# EAGLE design PCB_Robotique_EAGLE_Robotique_TEST (EAGLE 9.3.0)
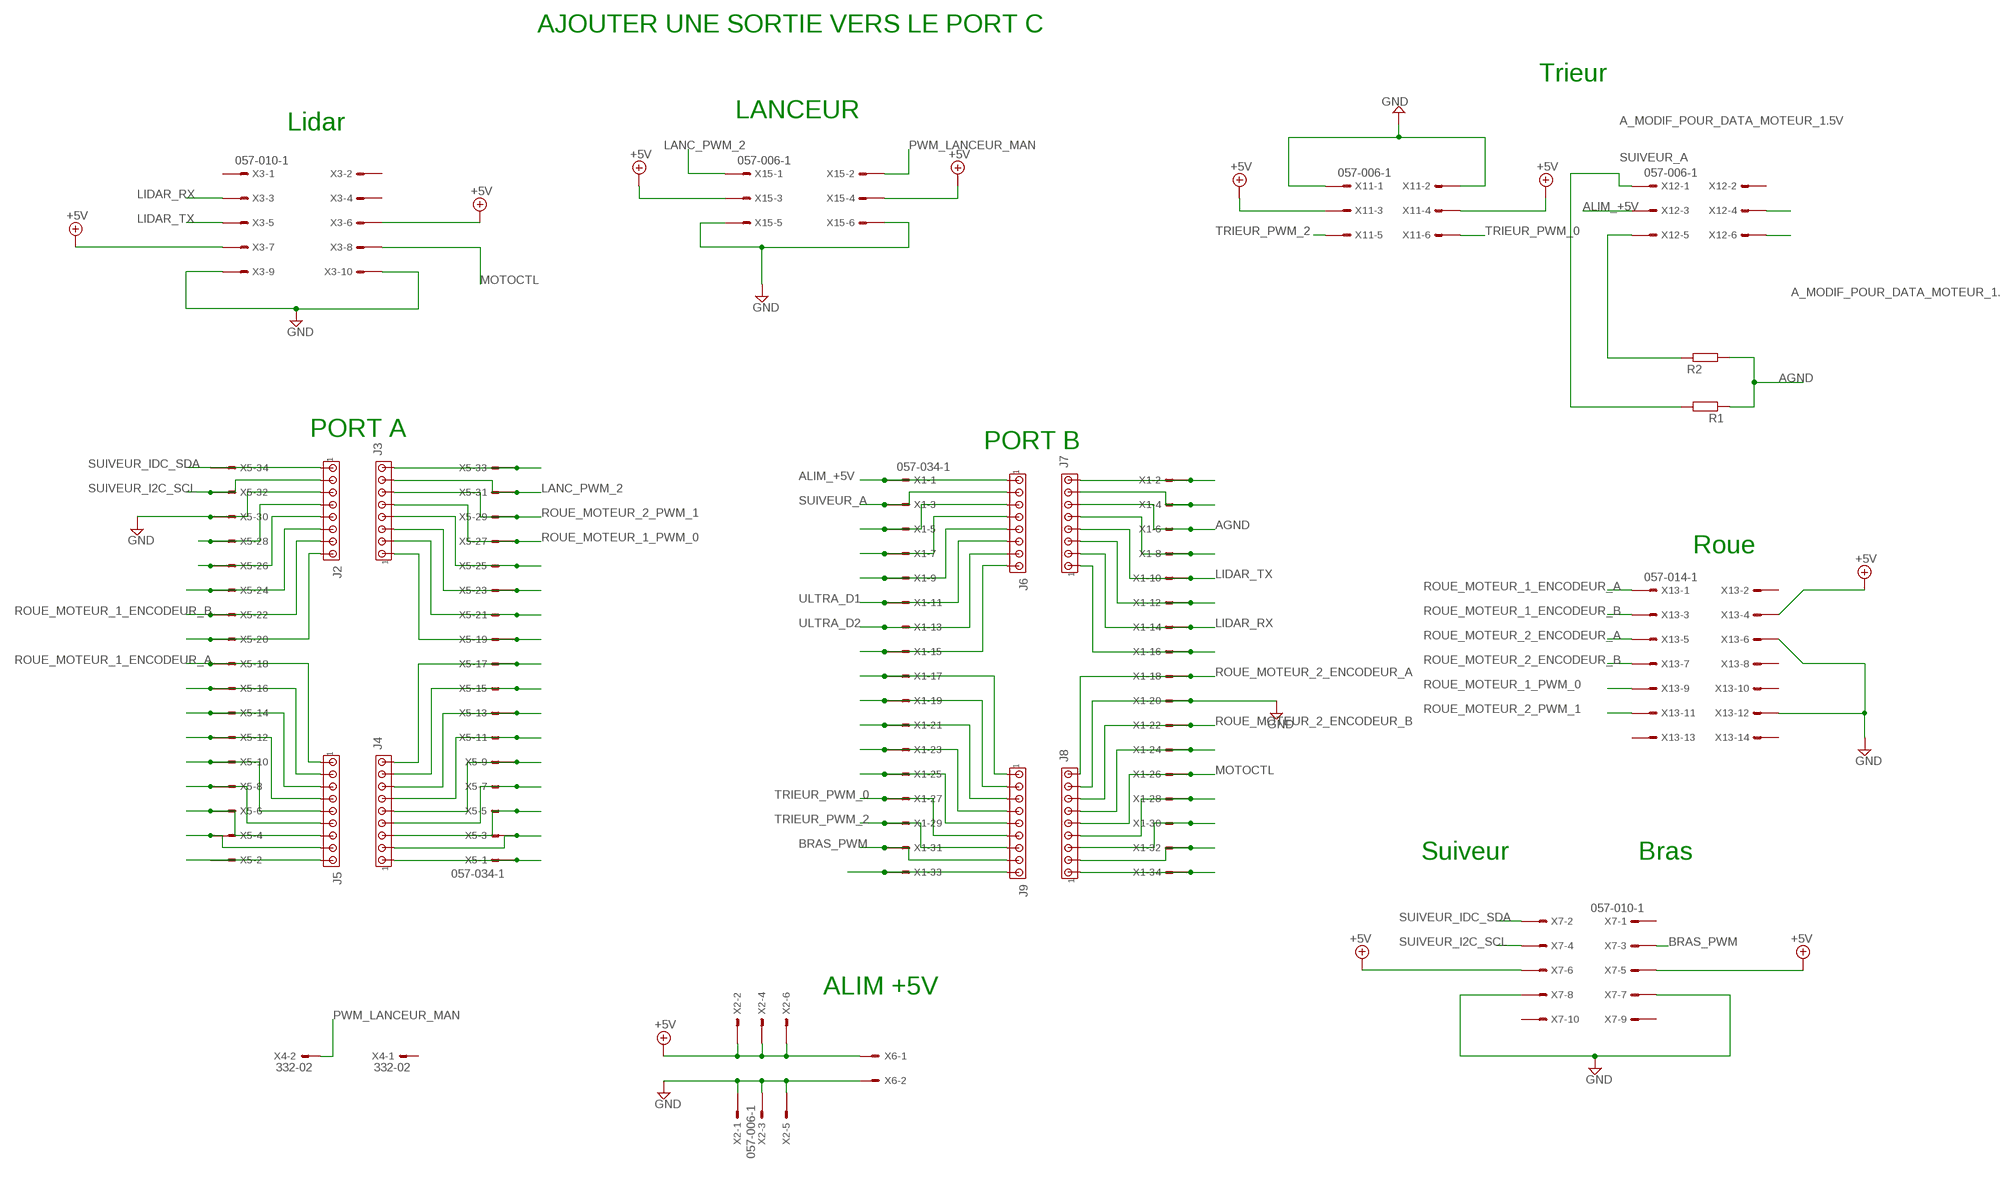
[diagram p0: schematic, sheet 1]

## Parts
J2  MTA08-100  [10X08MTA]
J3  MTA08-100  [10X08MTA]
J4  MTA09-100  [10X09MTA]
J5  MTA09-100  [10X09MTA]
J6  MTA08-100  [10X08MTA]
J7  MTA08-100  [10X08MTA]
J8  MTA09-100  [10X09MTA]
J9  MTA09-100  [10X09MTA]
R1  R1/4W  [R]
R2  R1/4W  [R]
X1  057-034-1  [057-034-1]
X2  057-006-1  [057-006-1]
X3  057-010-1  [057-010-1]
X4  332-02  [332-02]
X5  057-034-1  [057-034-1]
X6  KK-156-2  [KK-156-2]
X7  057-010-1  [057-010-1]
X11  057-006-1  [057-006-1]
X12  057-006-1  [057-006-1]
X13  057-014-1  [057-014-1]
X15  057-006-1  [057-006-1]

## Nets
4B: J7.7 X1.4
+5V: X2.2 X2.4 X2.6 X3.6 X3.7 X6.1 X7.5 X7.6 X11.3 X11.4 X13.4 X15.3 X15.4
A_MODIF_POUR_DATA_MOTEUR_1.5V: R2.1 X12.5
AGND: J7.6 R1.1 R2.2 X1.6
ALIM_+5V: J6.1 X1.1 X12.3
BRAS_PWM: J9.8 X1.31 X7.3
GND: J2.3 J8.8 X1.20 X2.1 X2.3 X2.5 X3.9 X3.10 X5.30 X6.2 X7.7 X7.8 X11.1 X11.2 X13.6 X13.12 X15.5 X15.6
LANC_PWM_2: J3.7 X5.31 X15.1
LIDAR_RX: J7.2 X1.14 X3.3
LIDAR_TX: J7.4 X1.10 X3.5
MOTOCTL: J8.5 X1.26 X3.8
N$1: J2.4 X5.28
N$3: J2.5 X5.26
N$4: J2.6 X5.24
N$6: J5.2 X5.16
N$7: J7.8 X1.2
N$9: J5.4 X5.12
N$10: J2.8 X5.20
N$11: J5.6 X5.8
N$13: J5.8 X5.4
N$14: J5.9 X5.2
N$15: J3.8 X5.33
N$16: J3.4 X5.25
N$17: J3.3 X5.23
N$18: J3.2 X5.21
N$19: J3.1 X5.19
N$20: J4.9 X5.17
N$21: J7.5 X1.8
N$23: J7.3 X1.12
N$24: J4.8 X5.15
N$25: J4.7 X5.13
N$26: J4.6 X5.11
N$27: J4.5 X5.9
N$28: J4.4 X5.7
N$29: J4.3 X5.5
N$30: J4.2 X5.3
N$31: J4.1 X5.1
N$33: J7.1 X1.16
N$34: J8.6 X1.24
N$36: J8.4 X1.28
N$37: J8.3 X1.30
N$38: J8.2 X1.32
N$39: J8.1 X1.34
N$40: J9.9 X1.33
N$41: J9.5 X1.25
N$42: J9.4 X1.23
N$43: J9.3 X1.21
N$44: J9.2 X1.19
N$45: J9.1 X1.17
N$46: J6.8 X1.15
N$47: J6.5 X1.9
N$48: J6.4 X1.7
N$49: J6.3 X1.5
N$51: X12.4
N$52: X12.6
N$59: J5.7 X5.6
PWM_LANCEUR_MAN: X4.2 X15.2
ROUE_MOTEUR_1_ENCODEUR_A: J5.1 X5.18 X13.1
ROUE_MOTEUR_1_ENCODEUR_B: J2.7 X5.22 X13.3
ROUE_MOTEUR_1_PWM_0: J3.5 X5.27 X13.9
ROUE_MOTEUR_2_ENCODEUR_A: J8.9 X1.18 X13.5
ROUE_MOTEUR_2_ENCODEUR_B: J8.7 X1.22 X13.7
ROUE_MOTEUR_2_PWM_1: J3.6 X5.29 X13.11
SDFSDFSGD: J5.5 X5.10
SDSSDFD: J5.3 X5.14
SUIVEUR_A: J6.2 R1.2 X1.3 X12.1
SUIVEUR_I2C_SCL: J2.2 X5.32 X7.4
SUIVEUR_IDC_SDA: J2.1 X5.34 X7.2
TRIEUR_PWM_0: J9.6 X1.27 X11.6
TRIEUR_PWM_2: J9.7 X1.29 X11.5
ULTRA_D1: J6.6 X1.11
ULTRA_D2: J6.7 X1.13
Unconnected: X3.1 X3.2 X3.4 X4.1 X7.1 X7.9 X7.10 X12.2 X13.2 X13.8 X13.10 X13.13 X13.14

## Notes on the sheet
- AJOUTER UNE SORTIE VERS LE PORT C
- Trieur
- LANCEUR
- Lidar
- PORT A
- PORT B
- Roue
- Suiveur | Bras
- ALIM +5V

## Library data of the parts
J2 J3 J6 J7 = con-amp:MTA08-100: AMP connector
J4 J5 J8 J9 = con-amp:MTA09-100: AMP connector
R1 R2 = isenproject:R: RESISTOR, European symbol
X1 X5 = con-panduit:057-034-: CONNECTOR 34-pin series 057 contact pc board low profile headers; OC_FARNELL: unknown; OC_NEWARK: unknown
X2 X11 X12 X15 = con-panduit:057-006-: CONNECTOR 6-pin series 057 contact pc board low profile headers; OC_FARNELL: unknown; OC_NEWARK: unknown
X3 X7 = con-panduit:057-010-: CONNECTOR 10-pin series 057 contact pc board low profile headers; OC_FARNELL: unknown; OC_NEWARK: unknown
X4 = con-garry:332-02: 2 Pin - 2mm Dual Row Source: www.mpe-connector.de / garry_shortform_2012.pdf
X6 = isenproject:KK-156-2: KK 156 HEADER Source: http://www.molex.com/pdm_docs/sd/026604100_sd.pdf; OC_FARNELL: unknown; OC_NEWARK: unknown
X13 = con-panduit:057-014-: CONNECTOR 10-pin series 057 contact pc board low profile headers; OC_FARNELL: unknown; OC_NEWARK: unknown

## Board
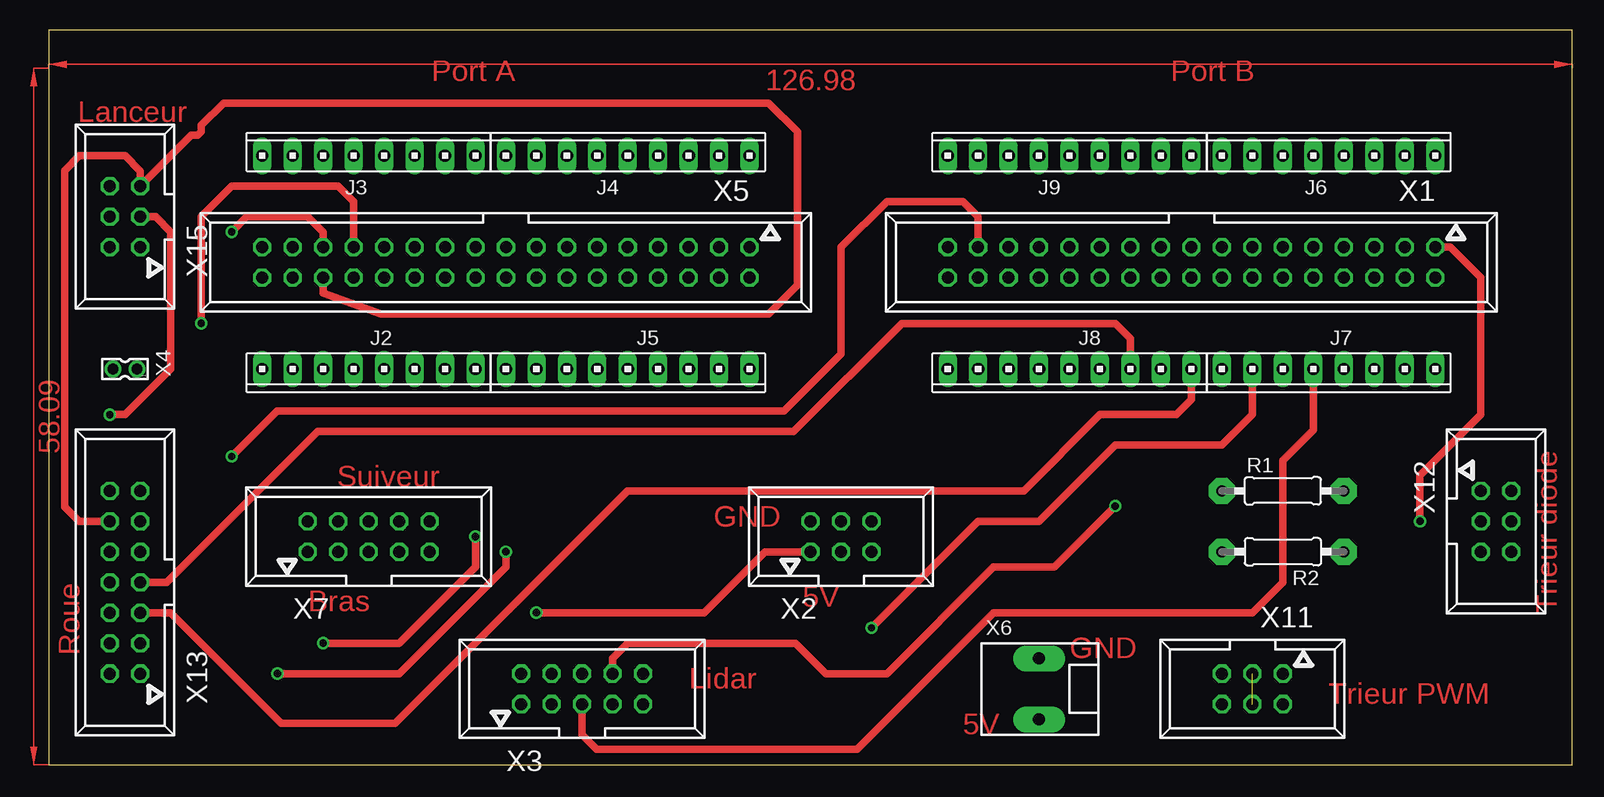
[diagram p1: board, top side]
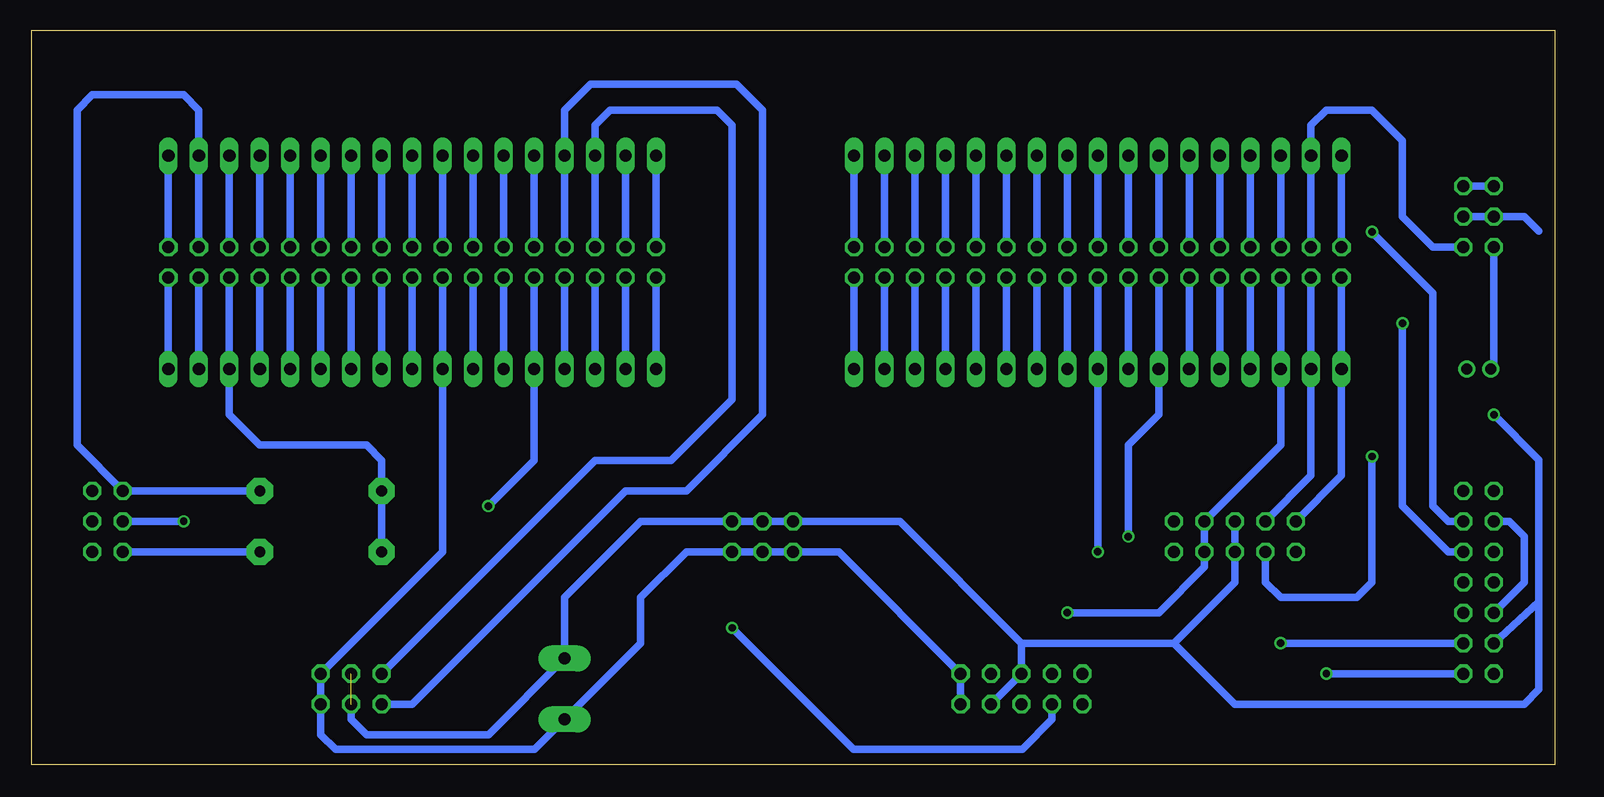
[diagram p2: board, bottom side, seen from below]

Size 126.98 x 61.29 mm. Coordinates in mm from the lower left corner, seen from the top.
Outline: 0,0 126.98,0 126.98,61.29 0,61.29 0,0
Copper layers (1*16): Top 0.035mm / dielectric 1.5mm / Bottom 0.035mm
Design rules "default": minimum track width 10mil, minimum drill 24mil, track to track 8mil, track to pad 8mil, pad to pad 8mil, via to via 8mil, smd to smd 8mil, copper to edge 40mil, drill to drill 8mil, minimum pad ring 10mil, minimum via ring 8mil, stop-mask expansion 4mil, vias tented up to drill 0mil, thermal gap 10mil

### Footprints (pad centres in the part's own frame; a part is rotated, then mirrored left to right if it is on the bottom)
10X08MTA = drill 1.016 long: 1 8.89,0; 2 6.35,0; 3 3.81,0; 4 1.27,0; 5 -1.27,0; 6 -3.81,0; 7 -6.35,0; 8 -8.89,0
10X09MTA = drill 1.016 long: 1 10.16,0; 2 7.62,0; 3 5.08,0; 4 2.54,0; 5 0,0; 6 -2.54,0; 7 -5.08,0; 8 -7.62,0; 9 -10.16,0
R = drill 0.9 pad 2.184 octagon: 1 -5.08,0; 2 5.08,0
057-034-1 = drill 1 octagon: 1 -20.32,-1.27; 2 -20.32,1.27; 3 -17.78,-1.27; 4 -17.78,1.27; 5 -15.24,-1.27; 6 -15.24,1.27; 7 -12.7,-1.27; 8 -12.7,1.27; 9 -10.16,-1.27; 10 -10.16,1.27; 11 -7.62,-1.27; 12 -7.62,1.27; 13 -5.08,-1.27; 14 -5.08,1.27; 15 -2.54,-1.27; 16 -2.54,1.27; 17 0,-1.27; 18 0,1.27; 19 2.54,-1.27; 20 2.54,1.27; 21 5.08,-1.27; 22 5.08,1.27; 23 7.62,-1.27; 24 7.62,1.27; 25 10.16,-1.27; 26 10.16,1.27; 27 12.7,-1.27; 28 12.7,1.27; 29 15.24,-1.27; 30 15.24,1.27; 31 17.78,-1.27; 32 17.78,1.27; 33 20.32,-1.27; 34 20.32,1.27
057-006-1 = drill 1 octagon: 1 -2.54,-1.27; 2 -2.54,1.27; 3 0,-1.27; 4 0,1.27; 5 2.54,-1.27; 6 2.54,1.27
057-010-1 = drill 1 octagon: 1 -5.08,-1.27; 2 -5.08,1.27; 3 -2.54,-1.27; 4 -2.54,1.27; 5 0,-1.27; 6 0,1.27; 7 2.54,-1.27; 8 2.54,1.27; 9 5.08,-1.27; 10 5.08,1.27
332-02 = drill 0.9 pad 1.27: 1 0,-1; 2 0,1
KK-156-2 = drill 1 pad 2.184 long: 1 -2.54,0; 2 2.54,0
057-014-1 = drill 1 octagon: 1 -7.62,-1.27; 2 -7.62,1.27; 3 -5.08,-1.27; 4 -5.08,1.27; 5 -2.54,-1.27; 6 -2.54,1.27; 7 0,-1.27; 8 0,1.27; 9 2.54,-1.27; 10 2.54,1.27; 11 5.08,-1.27; 12 5.08,1.27; 13 7.62,-1.27; 14 7.62,1.27

### Placement (x,y rotation side)
J2  26.67,33.02 180 top
J3  26.67,50.8 0 top
J4  48.26,50.8 0 top
J5  48.26,33.02 180 top
J6  106.68,50.8 0 top
J7  106.68,33.02 180 top
J8  85.09,33.02 180 top
J9  85.09,50.8 0 top
R1  102.87,22.86 0 top
R2  102.87,17.78 180 top
X1  95.25,41.91 180 top
X2  66.04,19.05 0 top
X3  44.45,6.35 0 top
X4  6.35,33.02 90 top
X5  38.1,41.91 180 top
X6  82.55,6.35 270 top
X7  26.67,19.05 0 top
X11  100.33,6.35 180 top
X12  120.65,20.32 270 top
X13  6.35,15.24 90 top
X15  6.35,45.72 90 top

### Tracks (layer width: path | path; a pad name or v marks a point on that pad's centre or on a via)
4B
  Bottom 0.61: J7.7 X1.4
+5V  (via drill 0.61)  (1 unrouted)
  Top 0.61: X15.3 8.89,45.72 10.16,44.45 10.16,33.02 6.35,29.21 v5.08,29.21
  Bottom 0.61: X7.6 X7.5 26.67,15.24 31.75,10.16 | X3.7 X3.6 44.45,10.16 | X11.4 100.33,3.81 99.06,2.54 88.9,2.54 X6.1 82.55,13.97 76.2,20.32 X2.6 X2.4 X2.2 54.61,20.32 44.45,10.16 | 44.45,10.16 31.75,10.16 | X15.3 X15.4 2.54,45.72 1.32,44.5 | 31.75,10.16 26.67,5.08 2.54,5.08 1.32,6.3 1.32,10.3 1.32,13.6 | v5.08,29.21 1.32,25.45 1.32,13.6 | 4.94,10.3 X13.4 1.32,13.6
A_MODIF_POUR_DATA_MOTEUR_1.5V
  Bottom 0.61: X12.5 R2.1
AGND
  Bottom 0.61: X1.6 J7.6 110.49,29.21 107.95,26.67 99.06,26.67 97.79,25.4 R1.1 R2.2
ALIM_+5V  (via drill 0.61)
  Top 0.61: v114.3,20.32 114.3,24.13 119.38,29.21 119.38,40.64 116.84,43.18 X1.1
  Bottom 0.61: J6.1 X1.1 | X12.3 v114.3,20.32
BRAS_PWM  (via drill 0.61)
  Top 0.61: X1.31 77.47,45.72 76.2,46.99 69.85,46.99 66.04,43.18 66.04,34.29 61.29,29.54 19.05,29.54 v15.24,25.73
  Bottom 0.61: J9.8 X1.31 | X7.3 24.13,15.24 22.86,13.97 16.51,13.97 15.24,15.24 v15.24,25.73
GND  (via drill 0.61)
  Top 0.61: X2.1 59.69,17.78 54.61,12.7 v40.64,12.7 | X13.12 2.54,20.32 1.32,21.54 1.32,49.58 2.54,50.8 6.35,50.8 7.62,49.53 X15.5 11.86,52.5 12.4,52.5 12.69,52.8 12.69,53.33 14.56,55.2 60,55.2 62.4,52.8 62.4,40 60,37.6 27.7,37.6 22.86,39.37 X5.30
  Bottom 0.61: X5.30 J2.3 22.86,26.67 X7.8 X7.7 29.21,16.51 33.02,12.7 v40.64,12.7 | X1.20 J8.8 92.71,17.78 X11.1 X11.2 102.87,2.54 101.65,1.32 85.04,1.32 X6.2 76.2,10.16 76.2,13.97 72.39,17.78 X2.5 X2.3 X2.1 59.69,17.78 X3.10 X3.9 | X15.6 X15.5 | X13.12 3.81,20.32 2.54,19.05 2.54,16.51 2.54,15.24 X13.6
LANC_PWM_2
  Bottom 0.61: X5.31 J3.7 20.32,53.34 19.05,54.61 15.24,54.61 12.7,52.07 12.7,45.72 11.43,44.45 10.16,43.18 X15.1
LIDAR_RX  (via drill 0.61)
  Top 0.61: 100.33,31.75 J7.2 100.33,29.21 97.79,26.67 88.9,26.67 82.55,20.32 77.47,20.32 v68.58,11.43
  Bottom 0.61: J7.2 X1.14 | X3.3 41.91,3.81 44.4,1.32 58.47,1.32 v68.58,11.43
LIDAR_TX
  Top 0.61: X3.5 44.45,2.54 45.67,1.32 67.36,1.32 | J7.4 105.41,27.94 102.87,25.4 102.87,15.24 100.33,12.7 78.74,12.7 67.36,1.32 | 67.36,1.32
  Bottom 0.61: X1.10 J7.4
MOTOCTL  (via drill 0.61)
  Top 0.61: X3.8 46.99,8.89 48.26,10.16 62.23,10.16 64.77,7.62 69.85,7.62 78.74,16.51 83.82,16.51 v88.9,21.59
  Bottom 0.61: X1.26 J8.5 85.09,25.4 v88.9,21.59
N$1
  Bottom 0.61: X5.28 J2.4
N$3
  Bottom 0.61: J2.5 X5.26
N$4
  Bottom 0.61: X5.24 J2.6
N$6
  Bottom 0.61: X5.16 J5.2
N$7
  Bottom 0.61: X1.2 J7.8
N$9
  Bottom 0.61: J5.4 X5.12
N$10
  Bottom 0.61: X5.20 J2.8
N$11
  Bottom 0.61: J5.6 X5.8
N$13
  Bottom 0.61: J5.8 X5.4
N$14
  Bottom 0.61: J5.9 X5.2
N$15
  Bottom 0.61: J3.8 X5.33
N$16
  Bottom 0.61: X5.25 J3.4
N$17
  Bottom 0.61: X5.23 J3.3
N$18
  Bottom 0.61: X5.21 J3.2
N$19
  Bottom 0.61: X5.19 J3.1
N$20
  Bottom 0.61: X5.17 J4.9
N$21
  Bottom 0.61: J7.5 X1.8
N$23
  Bottom 0.61: J7.3 X1.12
N$24
  Bottom 0.61: X5.15 J4.8
N$25
  Bottom 0.61: X5.13 J4.7
N$26
  Bottom 0.61: J4.6 X5.11
N$27
  Bottom 0.61: X5.9 J4.5
N$28
  Bottom 0.61: J4.4 X5.7
N$29
  Bottom 0.61: X5.5 J4.3
N$30
  Bottom 0.61: J4.2 X5.3
N$31
  Bottom 0.61: X5.1 J4.1
N$33
  Bottom 0.61: X1.16 J7.1
N$34
  Bottom 0.61: X1.24 J8.6
N$36
  Bottom 0.61: X1.28 J8.4
N$37
  Bottom 0.61: J8.3 X1.30
N$38
  Bottom 0.61: X1.32 J8.2
N$39
  Bottom 0.61: J8.1 X1.34
N$40
  Bottom 0.61: X1.33 J9.9
N$41
  Bottom 0.61: X1.25 J9.5
N$42
  Bottom 0.61: X1.23 J9.4
N$43
  Bottom 0.61: X1.21 J9.3
N$44
  Bottom 0.61: J9.2 X1.19
N$45
  Bottom 0.61: X1.17 J9.1
N$46
  Bottom 0.61: J6.8 X1.15
N$47
  Bottom 0.61: X1.9 J6.5
N$48
  Bottom 0.61: J6.4 X1.7
N$49
  Bottom 0.61: X1.5 J6.3
N$59
  Bottom 0.61: J5.7 X5.6
PWM_LANCEUR_MAN
  Bottom 0.61: X15.2 5.08,33.29 X4.2
ROUE_MOTEUR_1_ENCODEUR_A  (via drill 0.61)
  Top 0.61: v19.05,7.62 29.21,7.62 38.1,16.51 v38.1,17.78
  Bottom 0.61: 38.1,34.29 J5.1 | J5.1 X5.18 | v19.05,7.62 X13.1 | v38.1,17.78 J5.1
ROUE_MOTEUR_1_ENCODEUR_B  (via drill 0.61)
  Top 0.61: v22.86,10.16 29.21,10.16 35.56,16.51 v35.56,19.05
  Bottom 0.61: X5.22 J2.7 33.02,29.21 35.56,26.67 v35.56,19.05 | X13.3 v22.86,10.16
ROUE_MOTEUR_1_PWM_0  (via drill 0.61)
  Top 0.61: X5.27 25.4,46.99 24.13,48.26 15.24,48.26 12.7,45.72 v12.7,36.83
  Bottom 0.61: X5.27 J3.5 | v12.7,36.83 12.7,21.59 8.89,17.78 X13.9
ROUE_MOTEUR_2_ENCODEUR_A
  Top 0.61: J8.9 95.25,30.48 93.98,29.21 87.63,29.21 81.28,22.86 48.26,22.86 28.88,3.48 19.38,3.48 10.16,12.7 X13.5
  Bottom 0.61: 95.25,34.29 J8.9 X1.18
ROUE_MOTEUR_2_ENCODEUR_B
  Top 0.61: J8.7 90.17,35.56 88.9,36.83 71.12,36.83 62.09,27.8 22.39,27.8 9.83,15.24 X13.7
  Bottom 0.61: J8.7 X1.22
ROUE_MOTEUR_2_PWM_1  (via drill 0.61)
  Top 0.61: v15.24,44.45 16.51,45.72 21.59,45.72 22.86,44.45 X5.29
  Bottom 0.61: X5.29 J3.6 | v15.24,44.45 10.16,39.37 10.16,35.56 10.16,21.59 8.89,20.32 X13.11
SDFSDFSGD
  Bottom 0.61: J5.5 X5.10
SDSSDFD
  Bottom 0.61: J5.3 X5.14
SUIVEUR_A
  Bottom 0.61: R1.2 X12.1 123.19,26.67 123.19,54.61 121.92,55.88 114.3,55.88 113.03,54.61 J6.2 X1.3
SUIVEUR_I2C_SCL
  Bottom 0.61: X5.32 J2.2 20.32,24.13 X7.4
SUIVEUR_IDC_SDA
  Bottom 0.61: X5.34 J2.1 17.78,24.13 X7.2
TRIEUR_PWM_0
  Bottom 0.61: X1.27 J9.6 82.55,54.61 80.39,56.77 68.2,56.77 66.04,54.61 66.04,29.21 72.39,22.86 77.47,22.86 95.25,5.08 X11.6
TRIEUR_PWM_2
  Bottom 0.61: X1.29 J9.7 80.01,53.34 78.74,54.61 69.85,54.61 68.58,53.34 68.58,30.48 73.66,25.4 80.01,25.4 X11.5
ULTRA_D1
  Bottom 0.61: J6.6 X1.11
ULTRA_D2
  Bottom 0.61: X1.13 J6.7
(copper drawn outside any net)
  shapes: Top area x2

### Text on the board
Top: Port A | Port B | Lanceur | Suiveur | GND | Roue | Bras | 5V | Trieur diode | GND | Lidar | Trieur PWM | 5V